# Altium schematic sheet breakout.SchDoc
size A4; Organization: Arribada Initiative; Address1: https://github.com/arribada; Address2: contact@arribada.org; Address3: arribada.org; Address4: UK - Portsmouth
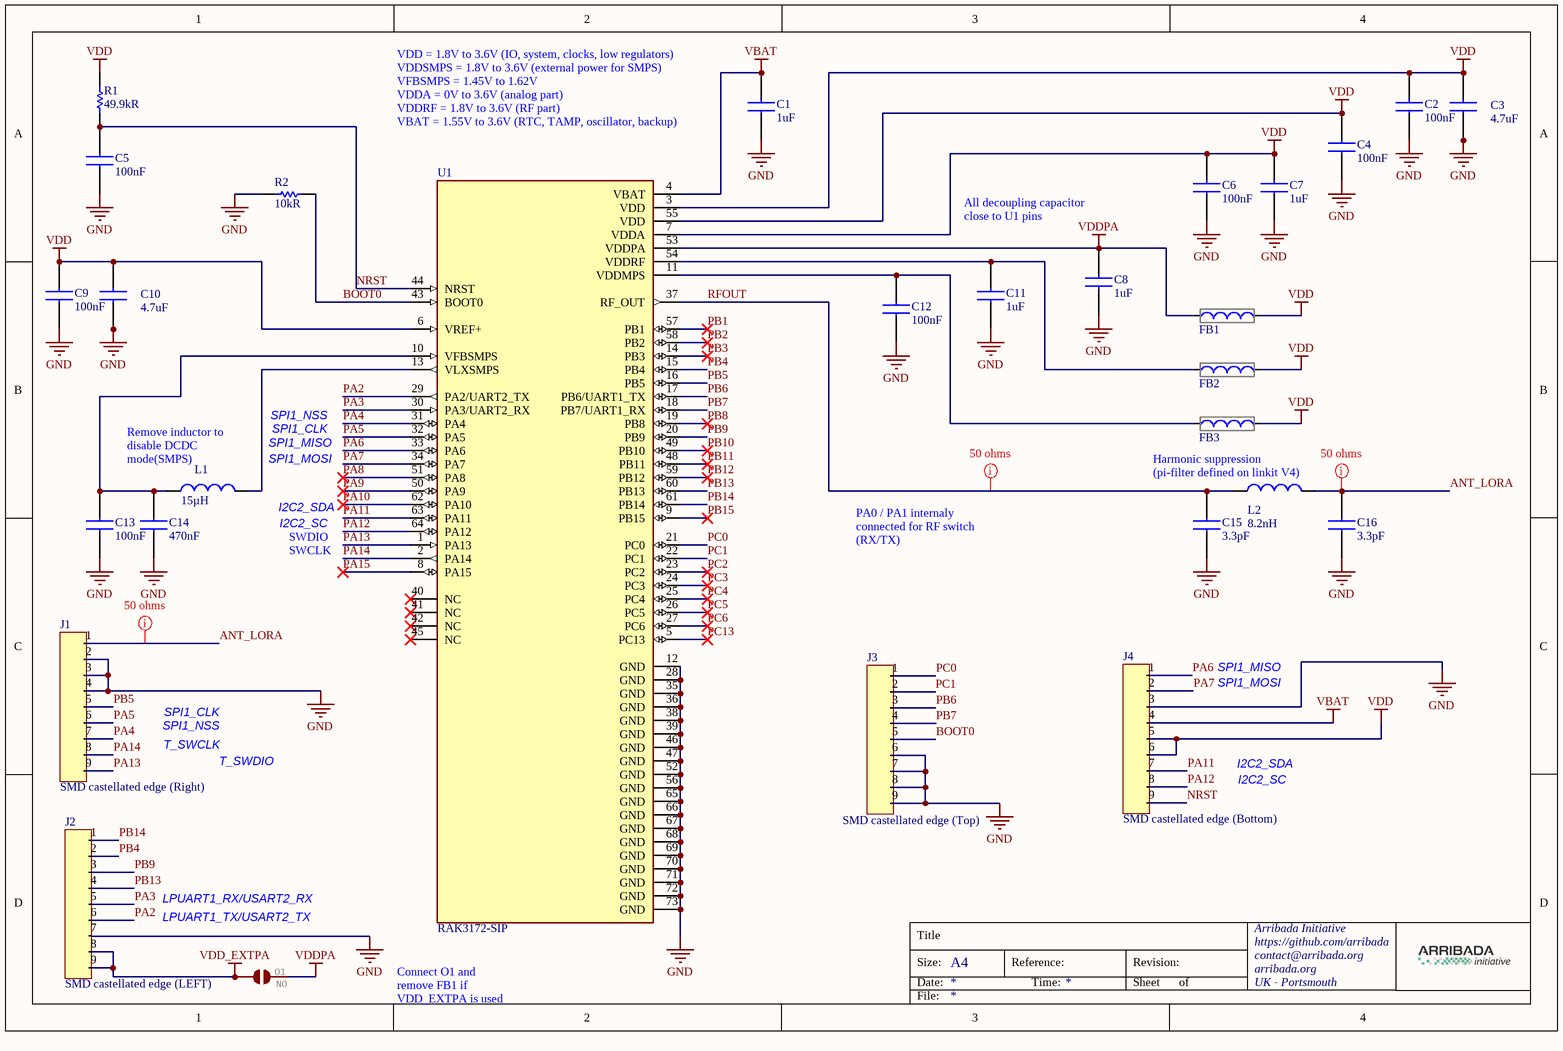
[diagram p0: breakout.SchDoc]

## Parts
C1  1uF  [CAPC1005X55N]
C2  value 100nF  [0402]  (hidden comment: GRM155R71C104KA88D)
C3  value 4.7uF  [CAPC1005X80N]  (hidden comment: ZRB15XR61A475KE01D)
C4  value 100nF  [0402]  (hidden comment: GRM155R71C104KA88D)
C5  value 100nF  [0402]  (hidden comment: GRM155R71C104KA88D)
C6  value 100nF  [0402]  (hidden comment: GRM155R71C104KA88D)
C7  1uF  [CAPC1005X55N]
C8  1uF  [CAPC1005X55N]
C9  value 100nF  [0402]  (hidden comment: GRM155R71C104KA88D)
C10  value 4.7uF  [CAPC1005X80N]  (hidden comment: ZRB15XR61A475KE01D)
C11  1uF  [CAPC1005X55N]
C12  value 100nF  [0402]  (hidden comment: GRM155R71C104KA88D)
C13  value 100nF  [0402]  (hidden comment: GRM155R71C104KA88D)
C14  value 470nF  [CAPC1005X55N]  (hidden comment: LMK105ABJ474KV8F)
C15  value 3.3pF  [CAPC1005X55N]  (hidden comment: GJM1555C1H3R3WB01D)
C16  value 3.3pF  [CAPC1005X55N]  (hidden comment: GJM1555C1H3R3WB01D)
FB1  BLM15AG121SH1D  [NFZ15SG152SN10B]  (value not drawn)
FB2  BLM15AG121SH1D  [NFZ15SG152SN10B]  (value not drawn)
FB3  BLM15AG121SH1D  [NFZ15SG152SN10B]  (value not drawn)
J1  SMD castellated edge (Right)  [9POS_VIA_0.6]
J2  SMD castellated edge (LEFT)  [9POS_VIA_0.6]
J3  SMD castellated edge (Top)  [9POS_VIA_0.6]
J4  SMD castellated edge (Bottom)  [9POS_VIA_0.6]
L1  value 15µH  [INDC1608X95N]  (hidden comment: MLZ1608M150WT000)
L2  value 8.2nH  [LQW18AN10NG80D]  (hidden comment: LQW18AN8N2C80D)
O1  NO  [SMT-JUMPER_2_NO_TRACE_SILK]  (net tie, no BOM)
R1  value 49.9kR  [RESC1005X40N]  (hidden comment: CRCW040249K9FKED)
R2  value 10kR  [RESC1005X40N]  (hidden comment: CRCW040210K0JNEDC)
U1  RAK3172-SIP  [XCVR_RAK3172-SIP]

## Nets
GND: C1.1 C2.1 C3.2 C4.1 C5.1 C6.1 C7.1 C8.1 C9.1 C10.2 C11.1 C12.1 C13.1 C14.2 C15.1 C16.1 J1.2 J1.3 J1.4 J2.7 J3.6 J3.7 J3.8 J3.9 J4.3 R2.2 U1.12(GND) U1.28(GND) U1.35(GND) U1.36(GND) U1.38(GND) U1.39(GND) U1.46(GND) U1.47(GND) U1.52(GND) U1.56(GND) U1.65(GND) U1.66(GND) U1.67(GND) U1.68(GND) U1.69(GND) U1.70(GND) U1.71(GND) U1.72(GND) U1.73(GND)
VBAT: C1.2 J4.4 U1.4(VBAT)
VDD: C2.2 C3.1 C4.2 C6.2 C7.2 C9.2 C10.1 FB1.2 FB2.2 FB3.2 J4.5 J4.6 R1.2 U1.3(VDD) U1.6(VREF+) U1.7(VDDA) U1.55(VDD)
VDD_EXTPA: J2.8 J2.9 O1.1
VDDPA: C8.2 FB1.1 O1.2 U1.53(VDDPA)
ANT_LORA: C16.2 J1.1 L2.2
BOOT0: J3.5 R2.1 U1.43(BOOT0)
NRST: C5.2 J4.9 R1.1 U1.44(NRST)
PA2: J2.6 U1.29(PA2/UART2_TX)
PA3: J2.5 U1.30(PA3/UART2_RX)
PA4: J1.7 U1.31(PA4)
PA5: J1.6 U1.32(PA5)
PA6: J4.1 U1.33(PA6)
PA7: J4.2 U1.34(PA7)
PA8: U1.51(PA8)
PA9: U1.50(PA9)
PA10: U1.62(PA10)
PA11: J4.7 U1.63(PA11)
PA12: J4.8 U1.64(PA12)
PA13: J1.9 U1.1(PA13)
PA14: J1.8 U1.2(PA14)
PA15: U1.8(PA15)
PB1: U1.57(PB1)
PB2: U1.58(PB2)
PB3: U1.14(PB3)
PB4: J2.2 U1.15(PB4)
PB5: J1.5 U1.16(PB5)
PB6: J3.3 U1.17(PB6/UART1_TX)
PB7: J3.4 U1.18(PB7/UART1_RX)
PB8: U1.19(PB8)
PB9: J2.3 U1.20(PB9)
PB10: U1.49(PB10)
PB11: U1.48(PB11)
PB12: U1.59(PB12)
PB13: J2.4 U1.60(PB13)
PB14: J2.1 U1.61(PB14)
PB15: U1.9(PB15)
PC0: J3.1 U1.21(PC0)
PC1: J3.2 U1.22(PC1)
PC2: U1.23(PC2)
PC3: U1.24(PC3)
PC4: U1.25(PC4)
PC5: U1.26(PC5)
PC6: U1.27(PC6)
PC13: U1.5(PC13)
RFOUT: C15.2 L2.1 U1.37(RF_OUT)
NetC11_2: C11.2 FB2.1 U1.54(VDDRF)
NetC12_2: C12.2 FB3.1 U1.11(VDDMPS)
NetC13_2: C13.2 C14.1 L1.1 U1.10(VFBSMPS)
NetL1_2: L1.2 U1.13(VLXSMPS)

Not connected (* = marked no-connect by the designer): U1 40(NC)* 41(NC)* 42(NC)* 45(NC)*

## Layout directives
net class 50Ohms; rule Impedance Constraint [Min = 50.00    Max = 50.00    ]: ANT_LORA, RFOUT

## Notes on the sheet
- (near U1) VDD = 1.8V to 3.6V (IO, system, clocks, low regulators)
  VDDSMPS = 1.8V to 3.6V (external power for SMPS)
  VFBSMPS = 1.45V to 1.62V
  VDDA = 0V to 3.6V (analog part)
  VDDRF = 1.8V to 3.6V (RF part)
  VBAT = 1.55V to 3.6V (RTC, TAMP, oscillator, backup)
- (near C8) All decoupling capacitor close to U1 pins
- SPI1_CLK
- SPI1_NSS
- SPI1_MISO
- (near L1) Remove inductor to disable DCDC mode(SMPS)
- (near L1) SPI1_MOSI
- (near L1) I2C2_SDA
- Harmonic suppression (pi-filter defined on linkit V4)
- SWCLK
- SWDIO
- I2C2_SC
- PA0 / PA1 internaly connected for RF switch (RX/TX)
- SPI1_MOSI
- T_SWCLK
- T_SWDIO
- I2C2_SDA
- LPUART1_TX/USART2_TX
- LPUART1_RX/USART2_RX
- Connect O1 and remove FB1 if VDD_EXTPA is used
- Title
- Size:
- Date:
- A4
- Reference:
- Time:
- Revision:
- Sheet
- of
- File:

## Library data of the parts
C1 C7 C8 C11 = GRM155Z71A105KE01J: Multilayer Ceramic Capacitors MLCC - SMD/SMT 1.0UF 10V 10% 0402; Manufacturer_Name: Murata Electronics; Manufacturer 1: Murata; Description 1: Multi-Layer Ceramic Capacitor 1uF X7R 10% 0402 Paper T/R; Datasheet Link: http://www.murata.com/~/media/webrenewal/support/library/catalog/products/capacitor/mlcc/c02e.pdf; Height: 0.55mm; Manufacturer_Part_Number: GRM155Z71A105KE01J; Mouser Part Number: 81-GRM155Z71A105KE1J; Mouser Price/Stock: https://www.mouser.co.uk/ProductDetail/Murata-Electronics/GRM155Z71A105KE01J?qs=xZ%2FP%252Ba9zWqaF%2FmyRgV0iOA%3D%3D; Arrow Part Number: GRM155Z71A105KE01J; Arrow Price/Stock: https://www.arrow.com/en/products/grm155z71a105ke01j/murata-manufacturing?region=nac; Supplier 1: Mouser; Supplier Part Number 1: 81-GRM155Z71A105KE1J; Manufacturer Part Number 1: GRM155Z71A105KE01J; RoHS 1: Yes; Category 1: Ceramic Capacitors; Stock 1: 804340; Pricing 1: 1=0,1, 10=0,069, 50=0,069, 100=0,031, 1000=0,018, 10000=0,013 (USD); Supplier 2: Digi-Key; Supplier Part Number 2: 490-GRM155Z71A105KE01JCT-ND; Manufacturer 2: Murata; Manufacturer Part Number 2: GRM155Z71A105KE01J; RoHS 2: Yes; Description 2: Multi-Layer Ceramic Capacitor 1uF X7R 10% 0402 Paper T/R; Category 2: Ceramic Capacitors; Stock 2: 80025; Pricing 2: 1=0,1, 10=0,063, 50=0,0344, 100=0,0281, 500=0,02006, 1000=0,01577, 2500=0,01433, 5000=0,01319 (USD); Value: 1uF
C2 C4-C6 C9 C12 C13 = GRM155R71C104KA88D: Multilayer Ceramic Capacitors MLCC - SMD/SMT 0.1 uF 16 VDC 10% 0402 X7R; Manufacturer_Part_Number: CC0402KRX7R7BB104; Manufacturer: YAGEO; Manufacturer 1: Murata; Description 1: 0402 0.1 uF 16V ±10 % Tolerance X7R SMT Multilayer Ceramic Capacitor; Voltage Rating: 16V; Package: C0402; Supplier 1: Mouser; Supplier Part Number 1: 81-GRM155R71C104KA88; Manufacturer Part Number 1: GRM155R71C104KA88D; RoHS 1: Yes; Category 1: Ceramic Capacitors; Stock 1: 7816691; Pricing 1: 1=0,1, 10=0,017, 50=0,017, 100=0,01, 1000=0,008, 10000=0,005 (USD); Mount: Surface Mount; Case/Package: 0402; Number of Pins: 2; Case Code (Metric): 1005; Case Code (Imperial): 0402; Material: Ceramic; Dielectric Material: Ceramic; Min Operating Temperature: -55°C; Max Operating Temperature: 125°C; Capacitance: 100nF; Tolerance: 10%; Packaging: Tape and Reel; Voltage Rating (DC): 16V; Package Quantity: 1; Dielectric: X7R; Termination: SMD/SMT; Voltage: 16V; Series: GRM; Length: 1mm; Width: 0.02inch; Height: 0.5mm; Thickness: 0.022inch; Depth: 0.5mm; Radiation Hardening: No; Lead Free: Lead Free; RoHS Compliant: Yes; Reach SVHC Compliant: Unknown; ComponentLink1URL: https://datasheet.ciiva.com/129/grm155r71c104ka88-01-129739.pdf?src-supplier=Digi-Key; ComponentLink1Description: https://datasheet.ciiva.com/129/grm155r71c104ka88-01-129739.pdf?src-supplier=Digi-Key; ComponentLink2URL: https://datasheet.ciiva.com/129/grm155r71c104ka88-01-129740.pdf?src-supplier=Digi-Key; ComponentLink2Description: https://datasheet.ciiva.com/129/grm155r71c104ka88-01-129740.pdf?src-supplier=Digi-Key; ComponentLink3URL: https://datasheet.ciiva.com/29199/454098-da-01-en-vs-kondensator-0402-29199799.pdf?src-supplier=Conrad; ComponentLink3Description: https://datasheet.ciiva.com/29199/454098-da-01-en-vs-kondensator-0402-29199799.pdf?src-supplier=Conrad; ComponentLink4URL: https://datasheet.ciiva.com/7937/4360-7937615.pdf?src-supplier=Element14; ComponentLink4Description: https://datasheet.ciiva.com/7937/4360-7937615.pdf?src-supplier=Element14; ComponentLink5URL: https://datasheet.ciiva.com/14116/grmseries-highdielectrictype-eng-14116878.pdf?src-supplier=Distrelec; ComponentLink5Description: https://datasheet.ciiva.com/14116/grmseries-highdielectrictype-eng-14116878.pdf?src-supplier=Distrelec; ComponentLink6URL: https://datasheet.ciiva.com/14103/grmseries-highdielectrictype-eng-14103750.pdf?src-supplier=Distrelec; ComponentLink6Description: https://datasheet.ciiva.com/14103/grmseries-highdielectrictype-eng-14103750.pdf?src-supplier=Distrelec; ComponentLink7URL: https://datasheet.ciiva.com/28534/4360-28534127.pdf?src-supplier=Element14; ComponentLink7Description: https://datasheet.ciiva.com/28534/4360-28534127.pdf?src-supplier=Element14; ComponentLink8URL: https://datasheet.ciiva.com/28534/4360-28534133.pdf?src-supplier=Element14; ComponentLink8Description: https://datasheet.ciiva.com/28534/4360-28534133.pdf?src-supplier=Element14
C3 C10 = ZRB15XR61A475KE01D: Multilayer Ceramic Capacitors MLCC - SMD/SMT 4.7 uF 10 VDC 10% 0402 X5R; Manufacturer_Name: Murata Electronics; Datasheet Link: https://componentsearchengine.com/Datasheets/1/ZRB15XR61A475KE01D.pdf; Height: 0.8mm; Manufacturer_Part_Number: ZRB15XR61A475KE01D; Mouser Part Number: 81-ZRB15XR61A475KE1D; Mouser Price/Stock: https://www.mouser.co.uk/ProductDetail/Murata-Electronics/ZRB15XR61A475KE01D?qs=I53XXhTNm8tY%252BZhQcsxAiQ%3D%3D; Arrow Part Number: ZRB15XR61A475KE01D; Arrow Price/Stock: https://www.arrow.com/en/products/zrb15xr61a475ke01d/murata-manufacturing
C14 = LMK105ABJ474KV8F: Multilayer Ceramic Capacitors MLCC - SMD/SMT  0.47uF 10V X5R 10% SMD 0402 85°C Paper T/R; Manufacturer 1: Taiyo Yuden; Description 1: Capacitor Ceramic 0.47uF 10V X5R 10% SMD 0402 85°C Paper T/R; Supplier 1: Mouser; Supplier Part Number 1: 963-LMK105ABJ474KV8F; Manufacturer Part Number 1: LMK105ABJ474KV8F; RoHS 1: Yes; Category 1: Ceramic Capacitors; Stock 1: 26528; Pricing 1: 1=0,1, 10=0,06, 50=0,06, 100=0,028, 1000=0,016, 10000=0,014 (USD)
C15 C16 = GJM1555C1H3R3WB01D: Multilayer Ceramic Capacitors MLCC - SMD/SMT 3.3 pF 50 VDC 0.05 pF 0402 C0G (NP0); Manufacturer_Name: Murata Electronics; Datasheet Link: https://search.murata.co.jp/Ceramy/image/img/A01X/G101/ENG/GJM1555C1H3R3WB01-01A.pdf; Height: 0.55mm; Manufacturer_Part_Number: GJM1555C1H3R3WB01D; Mouser Part Number: 81-GJM1555C1H3R3WB1D; Mouser Price/Stock: https://www.mouser.co.uk/ProductDetail/Murata-Electronics/GJM1555C1H3R3WB01D?qs=YLLXL5qGyDt2ejtN1v%252B1AA%3D%3D
FB1-FB3 = BLM15AG121SH1D: Ferrite Beads 120 OHM Alternate Sizing Guide Below; Manufacturer_Name: Murata Electronics; Datasheet Link: http://www.murata.com/~/media/webrenewal/support/library/catalog/products/emc/emifil/c31e.ashx?la=en-gb; Height: 0.55mm; Manufacturer_Part_Number: BLM15AG121SH1D; Mouser Part Number: 81-BLM15AG121SH1D; Mouser Price/Stock: https://www.mouser.co.uk/ProductDetail/Murata-Electronics/BLM15AG121SH1D?qs=%2F%252BYoplLUB5i4DkRkM50vHw%3D%3D; Arrow Part Number: BLM15AG121SH1D; Arrow Price/Stock: https://www.arrow.com/en/products/blm15ag121sh1d/murata-manufacturing
J1-J4 = 9POS_CAST: 9 POS Castellated connector with VIA 0.6
L1 = MLZ1608M150WT000: Inductor RF Shielded 15µH, ±5%; Manufacturer: TDK; Manufacturer_Part_Number: MLZ2012M150W; Description 1: Inductors For Decoupling Circuits, Multilayer Ferrite; Category 1: Fixed Inductors; Core Material: Ferrite; Tolerance: 20%; Saturation Current: 70mA; DC Resistance (DCR): 1.5R; Inductance: 15uH; Test Frequency: 2MHz; Supplier 1: Mouser; Supplier Part Number 1: 810-MLZ1608M150WT000; Manufacturer 1: TDK; Manufacturer Part Number 1: MLZ1608M150WT000; RoHS 1: Yes; Stock 1: 10538; Pricing 1: 1=0,15, 10=0,103, 50=0,103, 100=0,084, 1000=0,063, 10000=0,051 (USD); Mount: Surface Mount; Case/Package: 0603; Min Operating Temperature: -55°C; Max Operating Temperature: 125°C; Series: MLZ; Shielding: Shielded; RoHS Compliant: Yes
L2 = LQW18AN8N2C80D: Inductor Wirewound , 8.2 nH, 52 Milliohm, ± 0.2nH, 4.75 GHz, 1.6 A, 0603 [1608 Metric]; Manufacturer 1: Murata; Description 1: Wirewound Inductor, 8.2 nH, 52 Milliohm, ± 0.2nH, 4.75 GHz, 1.6 A, 0603 [1608 Metric]; Category 1: Fixed Inductors; Core Material: Non-Magnetic; DC Resistance (DCR): 52mR; Test Frequency: 100MHz; Shielding: Unshielded; Current Rating: 1.6A; Q Factor: 38; Supplier 1: Digi-Key; Supplier Part Number 1: 490-12792-1-ND; Manufacturer Part Number 1: LQW18AN8N2C80D; Stock 1: 3995; Pricing 1: 1=0,21, 10=0,191, 25=0,1696, 50=0,1442, 100=0,1273, 250=0,11664, 500=0,10604, 1000=0,08908 (USD); Mount: Surface Mount; Case/Package: 0603; Case Code (Metric): 1608; Case Code (Imperial): 0603; Min Operating Temperature: -55°C; Max Operating Temperature: 125°C; Self Resonant Frequency: 4.75GHz; Inductance: 8.2nH; Series: LQW18AN_80; Packaging: Tape and Reel; Package Quantity: 4000; Max DC Current: 1.6A; Termination: SMD/SMT; Length: 0.065inch; Width: 0.039inch; Height: 0.9mm; Height - Seated (Max): 0.039inch; RoHS Compliant: Yes; ComponentLink1URL: http://www.mouser.com/ds/2/281/murata_inductors-1115352.pdf?src-supplier=Mouser; ComponentLink1Description: http://www.mouser.com/ds/2/281/murata_inductors-1115352.pdf?src-supplier=Mouser; ComponentLink2URL: http://www.murata.com/~/media/webrenewal/support/library/catalog/products/inductor/chip/o05e.ashx?src-supplier=Digi-Key; ComponentLink2Description: http://www.murata.com/~/media/webrenewal/support/library/catalog/products/inductor/chip/o05e.ashx?src-supplier=Digi-Key; ComponentLink3URL: https://datasheet.octopart.com/LQW18AN8N2C80D-Murata-datasheet-142542943.pdf?src-supplier=Ciiva+Crawler; ComponentLink3Description: https://datasheet.octopart.com/LQW18AN8N2C80D-Murata-datasheet-142542943.pdf?src-supplier=Ciiva+Crawler; ComponentLink4URL: https://datasheet.octopart.com/LQW18AN8N2C80D-Murata-datasheet-141294533.pdf?src-supplier=Ciiva+Crawler; ComponentLink4Description: https://datasheet.octopart.com/LQW18AN8N2C80D-Murata-datasheet-141294533.pdf?src-supplier=Ciiva+Crawler; ComponentLink5URL: https://datasheet.octopart.com/LQW18AN8N2C80D-Murata-datasheet-140718063.pdf?src-supplier=Ciiva+Crawler; ComponentLink5Description: https://datasheet.octopart.com/LQW18AN8N2C80D-Murata-datasheet-140718063.pdf?src-supplier=Ciiva+Crawler; ComponentLink6URL: https://datasheet.octopart.com/LQW18AN8N2C80D-Murata-datasheet-138759090.pdf?src-supplier=Ciiva+Crawler; ComponentLink6Description: https://datasheet.octopart.com/LQW18AN8N2C80D-Murata-datasheet-138759090.pdf?src-supplier=Ciiva+Crawler; ComponentLink7URL: https://datasheet.octopart.com/LQW18AN8N2C80D-Murata-datasheet-145452284.pdf?src-supplier=Geoflip; ComponentLink7Description: https://datasheet.octopart.com/LQW18AN8N2C80D-Murata-datasheet-145452284.pdf?src-supplier=Geoflip; ComponentLink8URL: https://datasheet.octopart.com/LQW18AN8N2C80D-Murata-datasheet-142296119.pdf?src-supplier=Arrow.cn; ComponentLink8Description: https://datasheet.octopart.com/LQW18AN8N2C80D-Murata-datasheet-142296119.pdf?src-supplier=Arrow.cn; ComponentLink9URL: https://datasheet.octopart.com/LQW18AN8N2C80D-Murata-datasheet-20916938.pdf; ComponentLink9Description: https://datasheet.octopart.com/LQW18AN8N2C80D-Murata-datasheet-20916938.pdf
O1 = JUMPER-SMT_2_NO_TRACE_SILK_1: Normally opened trace jumper / This jumper has no trace between two pads so it's normally closed (NO).; GateName_1: G$1; SymbolName_1: SMT-JUMPER_2_NC_TRACE; DeviceName: _SILK; DeviceSetName: JUMPER-SMT_2_NC_TRACE; LibraryName: SparkFun-Jumpers
R1 = CRCW040249K9FKED: Thick Film Resistors - SMD 1/16watt 49.9Kohms 1%; Manufacturer_Name: Vishay; Datasheet Link: http://www.vishay.com/docs/20035/dcrcwe3.pdf; Height: 0.4mm; Manufacturer_Part_Number: CRCW040249K9FKED; Mouser Part Number: 71-CRCW0402-49.9K-E3; Mouser Price/Stock: https://www.mouser.co.uk/ProductDetail/Vishay-Dale/CRCW040249K9FKED?qs=hAuyw6LW%252BLhwjtjsHx%2FGDQ%3D%3D; Arrow Part Number: CRCW040249K9FKED; Arrow Price/Stock: https://www.arrow.com/en/products/crcw040249k9fked/vishay?region=nac
R2 = CRCW040210K0JNEDC: Thick Film Resistors - SMD 1/16watt 10Kohms 5% Commercial Use; Manufacturer: Vishay Semiconductors; Power Rating: 63mW; Voltage Rating: 50V; Supplier 1: Mouser; Manufacturer Part Number: CRCW040210K0JNEDC; RoHS: Yes; Category: Chip SMD Resistors; Stock 1: 229087; Pricing 1: 1=0,1, 10=0,013, 50=0,013, 100=0,007, 1000=0,005, 10000=0,004 (USD); Case/Package: 343Case; Resistance: 10kR; Tolerance: 5%; Height: 350um; Lead Free: 5697LeadFree; ComponentLink1URL: http://www.vishay.com/docs/28773/crcwce3.pdf?src-supplier=Digikey; ComponentLink1Description: http://www.vishay.com/docs/28773/crcwce3.pdf?src-supplier=Digikey; ComponentLink2URL: https://datasheet.octopart.com/CRCW040210K0JNEDC-Vishay-datasheet-100063072.pdf?src-supplier=Future+Electronics; ComponentLink2Description: https://datasheet.octopart.com/CRCW040210K0JNEDC-Vishay-datasheet-100063072.pdf?src-supplier=Future+Electronics; Supplier Part Number 1: 71-CRCW040210K0JNEDC
U1 = RAK3172-SIP: RAK3172-SiP is a low-power long-range transceiver based on STM32WLE5 SoC in a System-in-Package form factor.; MF: RAK; Package: Package; Price: None; Value: *; SnapEDA_Link: https://www.snapeda.com/parts/RAK3172-SiP/RAK/view-part/?ref=snap; MP: RAK3172-SiP; Availability: Not in stock; Check_prices: https://www.snapeda.com/parts/RAK3172-SiP/RAK/view-part/?ref=eda